# Altium project USB_Extension.PrjPcb
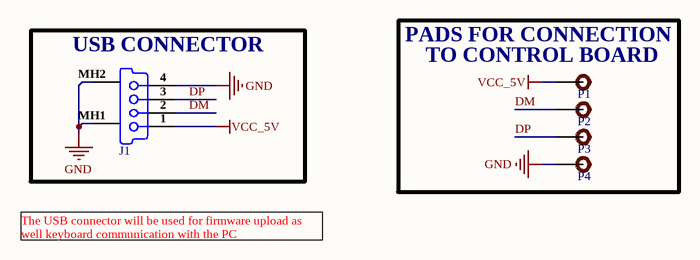
[diagram p0: Connector_Section.SchDoc]
1 sheet, 5 parts. Net scope: global (net labels, ports and power ports of the same name join across sheets).
Board file: USB_Extension.PcbDoc

## Sheet Connector_Section.SchDoc
size A; SheetNumber: 1; SheetTotal: 1

### Parts
J1  61400416021  [61400416021]  (value not drawn)
P1  (no value)  [TEST POINT]
P2  (no value)  [TEST POINT]
P3  (no value)  [TEST POINT]
P4  (no value)  [TEST POINT]

### Blocks framed on the sheet
USB CONNECTOR: J1

### Nets
GND: J1.4(NC) J1.MH1 J1.MH2 P4.1
VCC_5V: J1.1(V_BUS_(5V)) P1.1
DM: J1.2(D-) P2.1
DP: J1.3(D+) P3.1

### Notes on the sheet
- (near P1) PADS FOR CONNECTION
- (near P1) TO CONTROL BOARD
- The USB connector will be used for firmware upload as well keyboard communication with the PC

### Library data of the parts
J1 = 61400416021: CONN RCPT USB2.0 TYPEA 4POS R/A; Manufacturer: Wurth Electronics; Gender: Receptacle; Connector Type: USB; Number of Contacts: 4; Current Rating: 1A; Voltage Rating: 30V; Number of Ports: 1; Insulation Resistance: 1GR; Supplier 1: Digi-Key; Manufacturer Part Number: 61400416021; Stock 1: 7748; Pricing 1: 1=0.99, 10=0.874, 50=0.823, 100=0.739, 250=0.672 (USD); Mount: Through Hole,Horizontal; Contact Plating: Gold; Contact Material: Copper Alloy; Color: White; Min Operating Temperature: -40°C; Max Operating Temperature: 105°C; Packaging: Tray; Package Quantity: 60; Series: WR-COM; Number of Positions: 4; Termination: Solder; Orientation: Right Angle; USB Standard: USB 2.0; Length: 15.8mm; Width: 14.4mm; REACH SVHC: Unknown; Lead Free: Lead Free; Flammability Rating: UL94 V-0; ComponentLink1URL: https://www.distrelec.biz/Web/Downloads/he/et/4257096_eng_datasheet.pdf?mime=application%2Fpdf&src-supplier=Distrelec; ComponentLink1Description: https://www.distrelec.biz/Web/Downloads/he/et/4257096_eng_datasheet.pdf?mime=application%2Fpdf&src-supplier=Distrelec; ComponentLink2URL: http://www.farnell.com/datasheets/1712150.pdf?src-supplier=Element14; ComponentLink2Description: http://www.farnell.com/datasheets/1712150.pdf?src-supplier=Element14; ComponentLink3URL: http://www.farnell.com/datasheets/1712150.pdf?src-supplier=Newark; ComponentLink3Description: http://www.farnell.com/datasheets/1712150.pdf?src-supplier=Newark; ComponentLink4URL: http://katalog.we-online.de/kataloge/eican/media/pdf/61400416021.pdf?src-supplier=Mouser; ComponentLink4Description: http://katalog.we-online.de/kataloge/eican/media/pdf/61400416021.pdf?src-supplier=Mouser; ComponentLink5URL: https://katalog.we-online.de/em/datasheet/61400416021.pdf?src-supplier=Digi-Key; ComponentLink5Description: https://katalog.we-online.de/em/datasheet/61400416021.pdf?src-supplier=Digi-Key; ComponentLink6URL: http://documents.rs-components.com/techlib://itc_doclist_GB.htm?stockno=7480863&src-supplier=RSComponents; ComponentLink6Description: http://documents.rs-components.com/techlib://itc_doclist_GB.htm?stockno=7480863&src-supplier=RSComponents; ComponentLink7URL: http://www.produktinfo.conrad.com/datenblaetter/1000000-1099999/001088207-da-01-en-WR_COM_USB_TYP_A__61400416021.pdf?src-supplier=Conrad; ComponentLink7Description: http://www.produktinfo.conrad.com/datenblaetter/1000000-1099999/001088207-da-01-en-WR_COM_USB_TYP_A__61400416021.pdf?src-supplier=Conrad; Supplier Part Number 1: 732-2106-ND
P1-P4 = TEST POINT: Test Point ON